# Altium schematic sheet CONN_INPUT.SchDoc
size 558 x 431 mm; SheetNumber: 2; SheetTotal: 6; SPICEModelCacheBADTCNOH: <root> / <DocumentId>BADTCNOH</DocumentId> / </root>
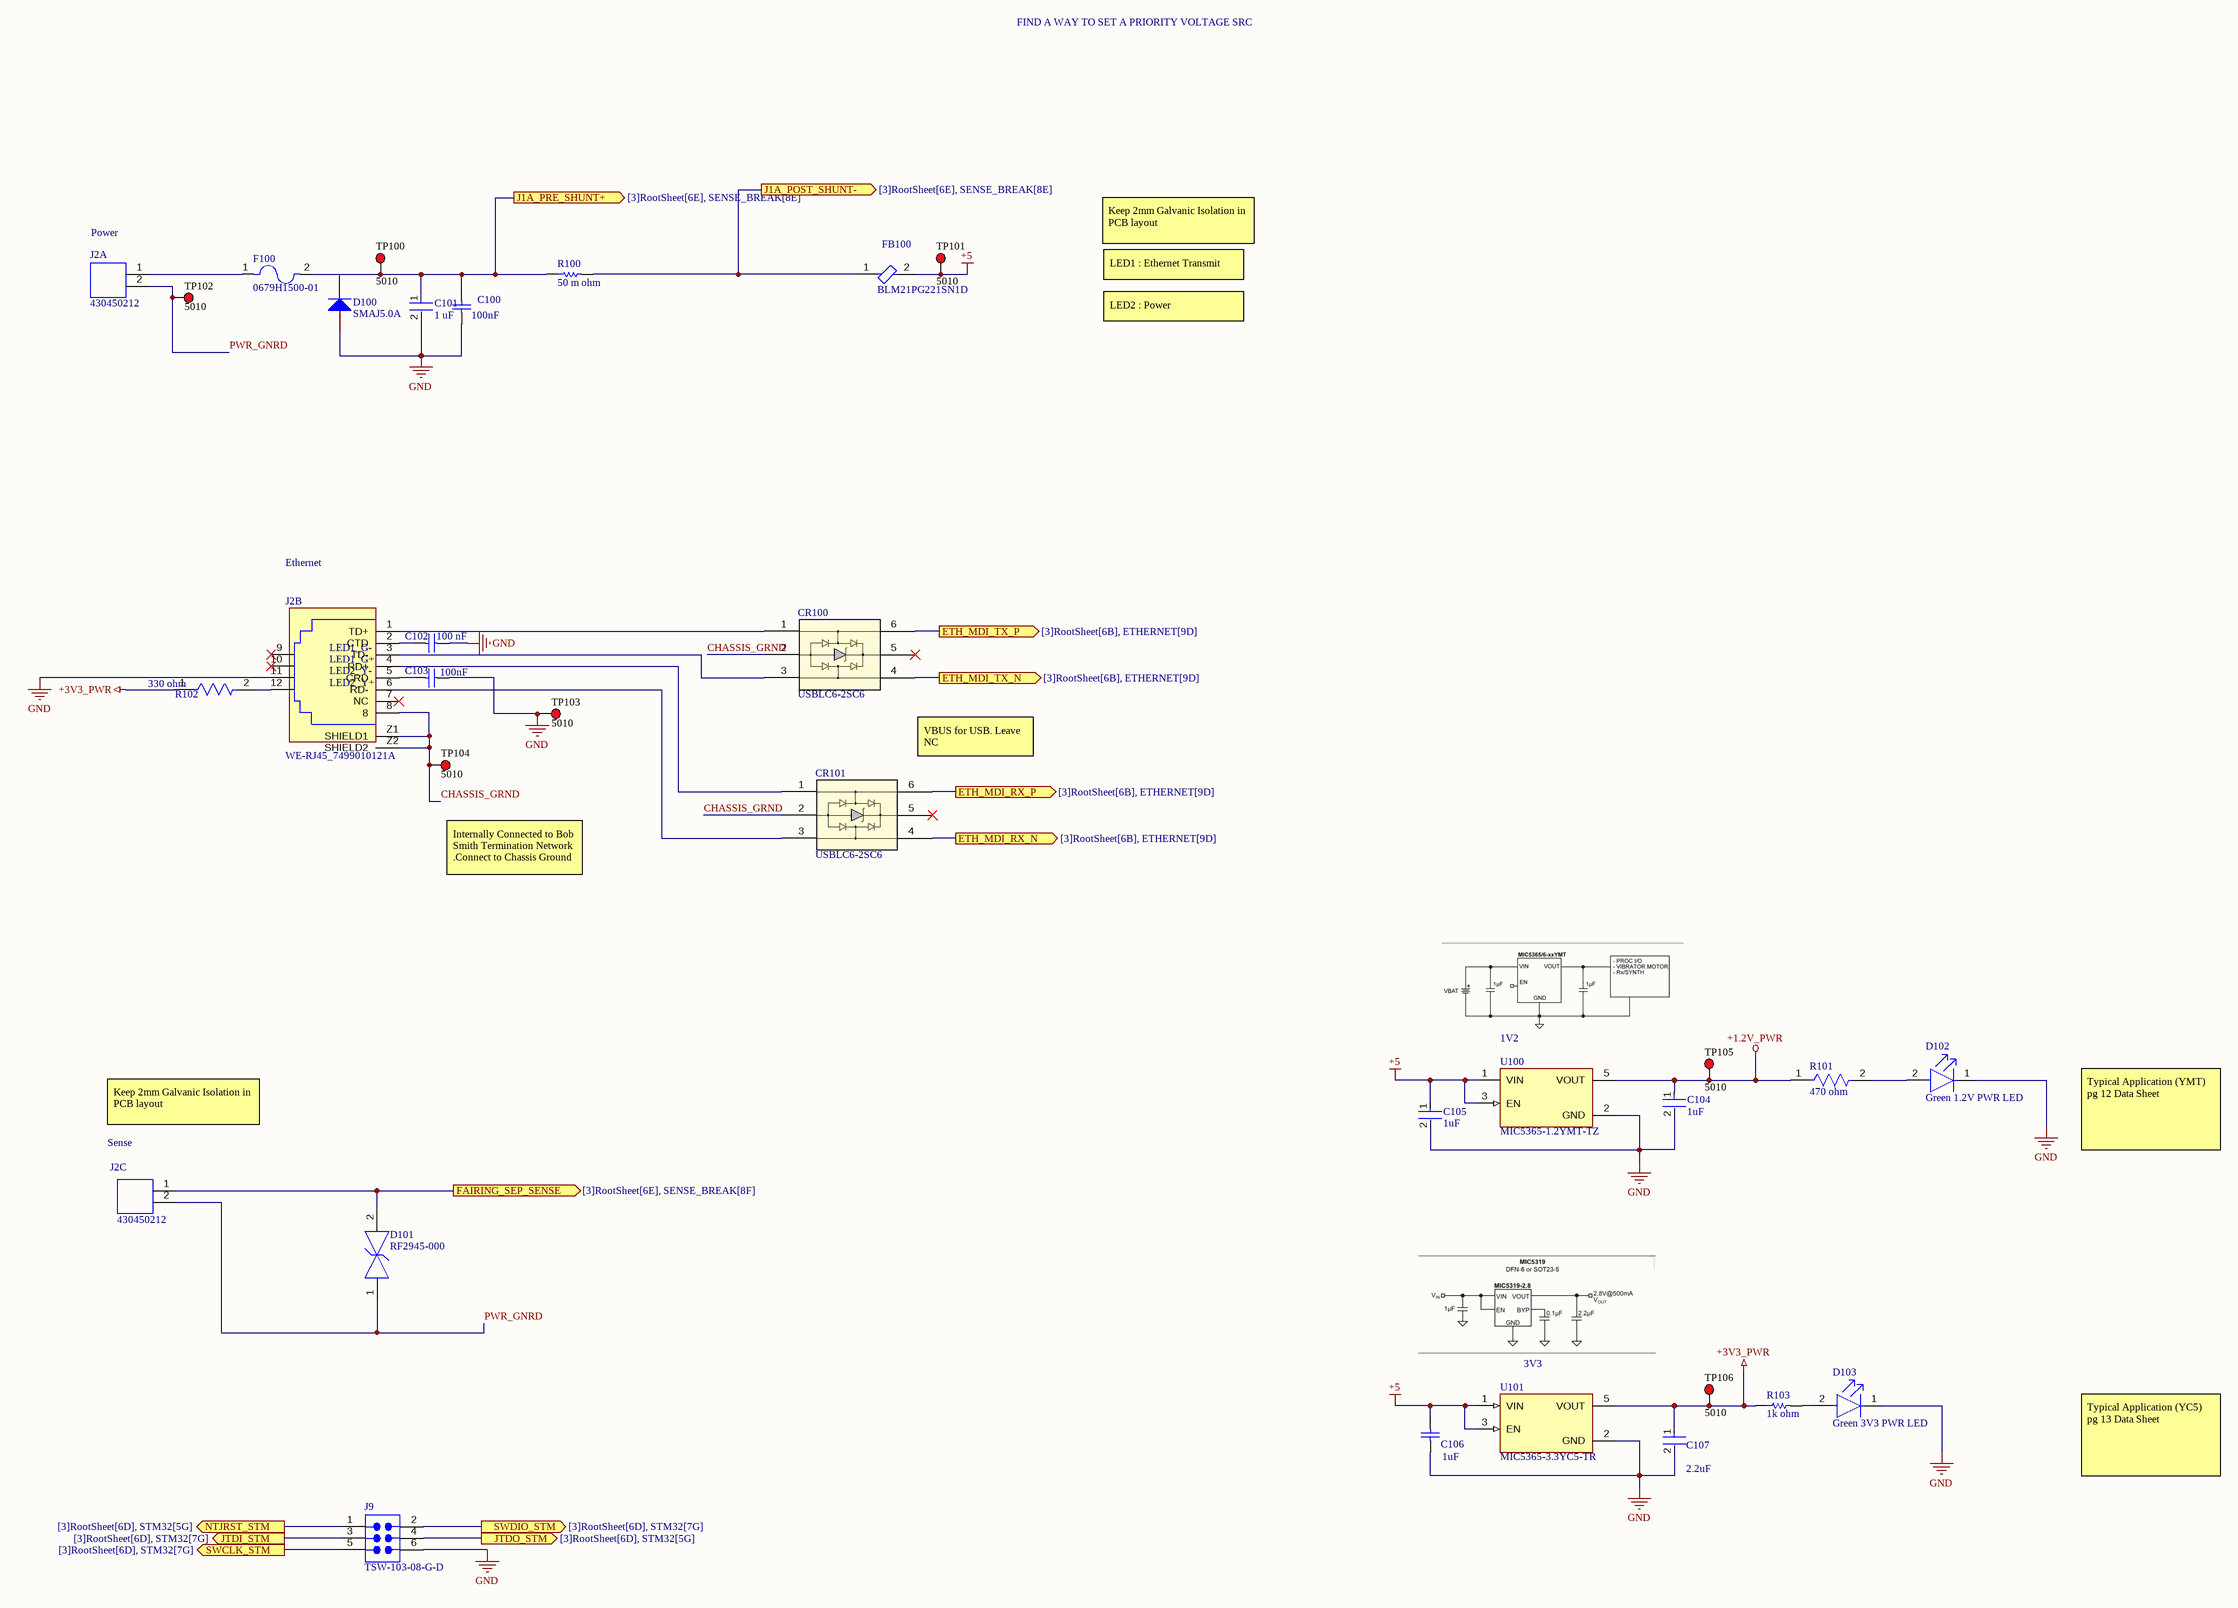
[diagram p0: CONN_INPUT.SchDoc]

## Parts
C100  100nF  [CAPC0603(1608)100_L]
C101  1 uF  [FP-GRM15-0_1-MFG]
C102  100 nF  [CAPC0603(1608)100_L]
C103  100nF  [CAPC0603(1608)100_L]
C104  1uF  [FP-GRM15-0_1-MFG]
C105  1uF  [FP-GRM15-0_1-MFG]
C106  1uF  [CAPC1005X55X10LL05]
C107  2.2uF  [FP-CC0603-DC-MFG]
CR100  USBLC6-2SC6  [SOT23-6L_STM]
CR101  USBLC6-2SC6  [SOT23-6L_STM]
D100  SMAJ5.0A  [BOUR-SMA-2_V]
D101  RF2945-000  [FP-SESD0402-MFG]
D102  Green 1.2V PWR LED  [FP-APHD1608LZGCK-MFG]
D103  Green 3V3 PWR LED  [FP-APHD1608LZGCK-MFG]
F100  0679H1500-01  [FUSC6125X279N]
FB100  BLM21PG221SN1D  [FP-BLM21-0_2-t0_85-e0_5-IPC_B]
J2A  430450212  [CONN_SD-43045-005_02_MOL]
J2B  WE-RJ45_7499010121A  [7499010121A]
J2C  430450212  [CONN_SD-43045-005_02_MOL]
J9  TSW-103-08-G-D  [SMTC-TSW-103-08-X-D]
R100  50 m ohm  [RESC3216X89X51LL25T25]
R101  470 ohm  [FP-RMCF0805-IPC_C]
R102  330 ohm  [FP-RMCF0603-MFG]
R103  1k ohm  [RESC2010(5025)_L]
TP100  5010  [KSTN-5010_V]
TP101  5010  [KSTN-5010_V]
TP102  5010  [KSTN-5010_V]
TP103  5010  [KSTN-5010_V]
TP104  5010  [KSTN-5010_V]
TP105  5010  [KSTN-5010_V]
TP106  5010  [KSTN-5010_V]
U100  MIC5365-1.2YMT-TZ  [TMLF-4_MCH]
U101  MIC5365-3.3YC5-TR  [TMLF-4_MCH]

## Ports
ETH_MDI_RX_N (out, see [3]RootSheet[6B], ETHERNET[9D]), ETH_MDI_RX_P (out, see [3]RootSheet[6B], ETHERNET[9D]), ETH_MDI_TX_N (out, see [3]RootSheet[6B], ETHERNET[9D]), ETH_MDI_TX_P (out, see [3]RootSheet[6B], ETHERNET[9D]), FAIRING_SEP_SENSE (out, see [3]RootSheet[6E], SENSE_BREAK[8F]), J1A_POST_SHUNT- (out, see [3]RootSheet[6E], SENSE_BREAK[8E]), J1A_PRE_SHUNT+ (out, see [3]RootSheet[6E], SENSE_BREAK[8E]), JTDI_STM (out, see [3]RootSheet[6D], STM32[7G]), JTDO_STM (out, see [3]RootSheet[6D], STM32[5G]), NTJRST_STM (out, see [3]RootSheet[6D], STM32[5G]), SWCLK_STM (out, see [3]RootSheet[6D], STM32[7G]), SWDIO_STM (out, see [3]RootSheet[6D], STM32[7G])

## Nets
+1.2V_PWR: C104.1 R101.1 TP105.1 U100.5(VOUT)
+3V3_PWR: C107.1 R102.1 R103.1 TP106.1 U101.5(VOUT)
+5: C105.1 C106.2 FB100.2 TP101.1 U100.1(VIN) U100.3(EN) U101.1(VIN) U101.3(EN)
GND: C100.1 C101.2 C102.1 C103.1 C104.2 C105.2 C106.1 C107.2 D100.1(A) D102.1(C) D103.1(C) J2B.11(LED2_Y-) J9.6 TP103.1 U100.2(GND) U101.2(GND)
CHASSIS_GRND: CR100.2 CR101.2 J2B.8 J2B.Z1(SHIELD1) J2B.Z2(SHIELD2) TP104.1
ETH_MDI_RX_N: CR101.4 ; port ETH_MDI_RX_N
ETH_MDI_RX_P: CR101.6 ; port ETH_MDI_RX_P
ETH_MDI_TX_N: CR100.4 ; port ETH_MDI_TX_N
ETH_MDI_TX_P: CR100.6 ; port ETH_MDI_TX_P
FAIRING_SEP_SENSE: D101.2 J2C.1 ; port FAIRING_SEP_SENSE
J1A_POST_SHUNT-: FB100.1 R100.2 ; port J1A_POST_SHUNT-
J1A_PRE_SHUNT+: C100.2 C101.1 F100.2 R100.1 TP100.1 ; port J1A_PRE_SHUNT+
JTDI_STM: J9.3 ; port JTDI_STM
JTDO_STM: J9.4 ; port JTDO_STM
NTJRST_STM: J9.1 ; port NTJRST_STM
PWR_GNRD: D101.1 J2A.2 J2C.2 TP102.1
SWCLK_STM: J9.5 ; port SWCLK_STM
SWDIO_STM: J9.2 ; port SWDIO_STM
NetC102_2: C102.2 J2B.2(CTD)
NetC103_2: C103.2 J2B.5(CRD)
NetCR100_1: CR100.1 J2B.1(TD+)
NetCR100_3: CR100.3 J2B.3(TD-)
NetCR101_1: CR101.1 J2B.4(RD+)
NetCR101_3: CR101.3 J2B.6(RD-)
NetD102_2: D102.2(A) R101.2
NetD103_2: D103.2(A) R103.2
NetF100_1: F100.1 J2A.1
NetJ2B_12: J2B.12(LED2_Y+) R102.2

Not connected (* = marked no-connect by the designer): CR100 5*; CR101 5*; D100 2(K); J2B 7(NC)* 9(LED1_G-)* 10(LED1_G+)*

## Notes on the sheet
- FIND A WAY TO SET A PRIORITY VOLTAGE SRC
- (near J2A) Power
- Keep 2mm Galvanic Isolation in PCB layout
- LED1 : Ethernet Transmit
- LED2 : Power
- Ethernet
- VBUS for USB. Leave NC
- Internally Connected to Bob Smith Termination Network .Connect to Chassis Ground
- (near U100) 1V2
- (near J2C) Sense
- Typical Application (YMT) pg 12 Data Sheet
- (near U101) 3V3
- Typical Application (YC5) pg 13 Data Sheet
- DWG. NO.
- REV.
- SHT.
- REVISION
- DESCRIPTION
- DATE
- APPROVED
- THIS DOCUMENT AND THE DATA DISCLOSED HEREIN OR HEREWITH IS THE PROPERTY OF ALTIUM LIMITED AND MAY BE FREELY DISTRIBUTED IN WHOLE. NO RIGHTS ARE RESERVED OR EXPRESS OR IMPLIED WARANTEE GIVEN.
- ENG:
- DSN:
- APPROVALS
- PROJECT
- DOCUMENT REVISION:
- DESIGN ITEM:
- CHK:
- BOM:
- REFERENCE DOCUMENTS
- PROJECT REVISION:
- TITLE
- FAB DWG:
- PCB DWG:
- ASSY DWG:
- SCALE:
- SIZE
- C
- CAGE CODE
- FILE NAME
- DWG NO.
- SHEET
- OF
- REV

## Library data of the parts
C100 C102 C103 = CMP-1035-02591-1: CAP 100nF 50V ±5% 0603 (1608 Metric) Thickness 1mm SMD; Tolerance: Â±5%; Case-Metric: 1608; Case-EIA: 0603; Rated Voltage: 50 V; Max Thickness: 1 mm; Technology: SMT; Value: 100nF
C101 C104 C105 = CMP-2008-04556-2: CAP CER 1UF 10V X5R 0402; Manufacturer Part Number: GRM155R61A105KE15D; Manufacturer: Murata; Material: Ceramic; Tolerance: 10%; Temperature Coefficient: 15%; Octopart: https://octopart.com/grm155r61a105ke15d-murata-197442; Lead Free: Yes; ComponentLink2Description: Datasheet; Temperature: -55°C to +85°C; Temperature Range High: +85°C; Height: 0.55mm; Capacitance: 1uF; Ipc Land Pattern Name: CAPC10050X50; ComponentLink2URL: https://search.murata.co.jp/Ceramy/image/img/A01X/G101/ENG/GRM155R61A105KE15-01A.pdf; Temperature Range Low: -55°C; Device Class L2: Capacitors; Voltage Rating: 10V; RoHS: TRUE; Device Class L1: Passive Components; Device Class L3: Ceramic Capacitors; Temperature Characteristic: X5R; Mouser Description: 0402 1 uF 10 V ±10% Tolerance X5R Surface Mount Multilayer Ceramic Capacitor; Automotive: No; Package: GRM15-0.1; Digikey Description: CAP CER 1UF 10V X5R 0402; Value: 1uF; Category: Cap
C106 = CMP-2000-05996-1: Multilayer Ceramic Chip Capacitor, 1 uF, +/- 10%, 10 V, -55 to 85 degC, 0402 (1005 Metric), RoHS, Tape and Reel; Manufacturer: TDK; PCN Part Number: MLCCPartNumberChange30/Nov/2012; Product Training Modules: CSeriesGeneralApplicationsSEAT,CCV,andTVCLDesignToolsGuidetoReplacinganElectrolyticCapacitorwithanMLCC; Voltage - Rated: 10V; Temperature Coefficient: X5R; Online Catalog: CSeries,GeneralPurpose; Capacitance: 1µF; Other Names: 445-4114-6; Category: Capacitors; Features: -; Lead Style: -; RoHS Information: RoHSCertificate-MLCC; Manufacturer URL: http://www.tdk.com/; Lead Spacing: -; Thickness (Max): 0.022"(0.55mm); Applications: GeneralPurpose; Tolerance: ±10%; Mounting Technology: SurfaceMount; Mounting Type: SurfaceMount,MLCC; Operating Temperature: -55°C~85°C; Datasheet URL: http://download.siliconexpert.com/pdfs/2015/4/21/15/54/45/779/tdk_/manual/37024850441143360mlcc_commercial_general_en.pdf; Package Reference: 1005; Height - Seated (Max): -; Family: CeramicCapacitors; Datasheet Version: 03/2015; Package Description: 2-Pin Surface Mount Device, Body 1 x 0.5 mm; Packaging: Digi-Reel®; Size / Dimension: 0.039"Lx0.020"W(1.00mmx0.50mm); Standard Package: 1; Package / Case: 0402(1005Metric); Ratings: -; Series: C
C107 = CMP-03422-000578-2: CAP CER 2.2UF 50V X5R 0603; Tolerance: 10%; Packaging: Cut Tape; Capacitance: 2.2uF; Min Operating Temperature: -55°C; RoHS Compliant: Yes; Max Operating Temperature: 85°C; Case Code (Metric): 1608; Voltage Rating: 50V; Case/Package: 0603; Case Code (Imperial): 0603; Mount: Surface Mount
CR100 CR101 = USBLC6-2SC6: ESD Protection for USB 2.0 High Speed; Manufacturer_Name: STMicroelectronics; Copyright: Copyright (C) 2025 Ultra Librarian. All rights reserved.; Manufacturer_Part_Number: USBLC6-2SC6; RefDes: RefDes; Type: Type
D100 = CMP-2000-07090-1: SMAJ Transient Voltage Suppressor Diode Series, 3.5 V, -55 to 150 degC, 2-Pin SMA, RoHS, Tape and Reel; Manufacturer: Bourns; EDA / CAD Models: DownloadfromAcceleratedDesigns; Unidirectional Channels: 1; Voltage - Breakdown (Min): 6.4V; Voltage - Reverse Standoff (Typ): 5V; Voltage - Clamping (Max) @ Ipp: 9.2V; Other Names: SMAJ5.0ABDKR; Type: Zener; Catalog Drawings: SMAJSeriesFootprintSMAJ,SMBJSeries; Featured Product: SMAJ/SMBJ/SMCJ/SMLJDiscreteTVSDiodes; Power - Peak Pulse: 400W; Current - Peak Pulse (10/1000µs): 43.5A; Power Line Protection: No; Online Catalog: SMAJSeries; Supplier Device Package: SMA(DO-214AC); Operating Temperature: -55°C~150°C(TJ); Package Description: 2-Pin Surface Mount Device, Body 4.315 x 2.605 mm; Datasheet URL: https://datasheet.ciiva.com/25624/0900766b8112213b-25624680.pdf; Manufacturer URL: http://www.bourns.com/; Datasheet Version: 08/2012; Series: SMAJ; Family: TVS-Diodes; Bidirectional Channels: -; Applications: GeneralPurpose; Package Reference: SMA-2; Standard Package: 1; Package / Case: DO-214AC,SMA; Category: CircuitProtection; RoHS Information: SMAJSeriesMaterialDeclaration; Mounting Technology: SurfaceMount; Capacitance @ Frequency: -; Packaging: Digi-Reel®; Mounting Type: SurfaceMount
D101 = CMP-08607-000062-1: TVS DIODE 7V 10V 0402; Manufacturer: Littelfuse; Value: 0.1pF; Breakdown Voltage: 9.8V; Number Of Channels: 1; Peak Pulse Current: 2A; Direction: Bidirectional; Automotive Grade: Grade 1; Standoff Height: 0mm; Octopart: https://octopart.com/rf2945-000-littelfuse-56516902; Device Class L3: unset; ComponentLink2Description: Datasheet; Lead Free: Yes; Temperature Range Low: -55°C; Clamping Voltage: 10V; Digikey Description: TVS DIODE 7V 10V 0402; Category: Diode; Temperature: -55°C to +125°C; Device Class L1: Circuit Protection; Capacitance: 0.1pF; RoHS: TRUE; Device Class L2: TVS Diodes; Package: SESD0402; Reverse Standoff Voltage: 7V; Automotive: Yes; Height: 0.43mm; Manufacturer Part Number: RF2945-000; Temperature Range High: +125°C; ComponentLink2URL: https://www.littelfuse.com/~/media/electronics/datasheets/tvs_diode_arrays/littelfuse_tvs_diode_array_sesd_ultra_low_capacitance_discrete_tvs_datasheet.pdf.pdf
D102 D103 = CMP-44529-000045-1: LED GREEN CLEAR 1608 SMD; Test Current: 2mA; Dominant Wavelength: 525nm; Lens Color: Colorless; Luminous Intensity: 180mcd; Viewing Angle: 100°; Forward Voltage: 2.65V; Lens Size: 0.7mm; Lens Style: Round; Mount: Surface Mount; Packaging: Tape and Reel; Lens Transparency: Clear; Height: 0.75mm; Case/Package: 0603; Length: 1.6mm; Case Code (Metric): 1608; Width: 0.8mm; Color: Green; Case Code (Imperial): 0603
F100 = 0679H1500-01: 2410 SMT Fuse | Quick Acting | 250mA | Higher AC Voltage; Package: None; Price: None; Value: *; MP: 0679H1500-01; Availability: Unavailable
FB100 = CMP-0686-00610-3: Chip Ferrite Bead, 0805, 220Ω @ 100MHz, 0.045Ω, 25%, 2A; Number of Circuits: 1; Shielding: Unshielded; DC Resistance (DCR): 45mR; Impedance: 220R; Radiation Hardening: No; Material: Ferrite; Frequency: 100MHz; Width: 1.25mm; DC Current: 2A; Max DC Current: 2A; Number of Lines: 1; Package Quantity: 1; Case Code (Metric): 2012; Current Rating: 2A; Case/Package: 0805; Current: 2A; Military Standard: Not; Core Material: Ferrite; Depth: 1.25mm; Contact Plating: Tin; DC Resistance-Max: 45mR; Max Operating Temperature: 125°C; Length: 2mm; Max Current Rating: 2A; REACH SVHC: No SVHC; Termination: SMD/SMT; Min Operating Temperature: -55°C; Series: BLM21P; Test Frequency: 100MHz; Tolerance: 25%; Number of Pins: 2; RoHS Compliant: Yes; Height: 0.85mm; Packaging: Tape and Reel; Lead Free: Lead Free; Case Code (Imperial): 0805
J2A J2C = 430450212: Connector Header Through Hole 2 position; MF: Molex; SnapEDA_Link: https://www.snapeda.com/parts/430450212/Molex/view-part/?ref=snap; Package: None; Value: *; MP: 430450212; Check_prices: https://www.snapeda.com/parts/430450212/Molex/view-part/?ref=eda
J2B = WE-RJ45_7499010121A: MF: {'manufacturer': u'Wurth Electronics'}; Package: None; Price: None; Value: *; MP: 7499010121A; Availability: Unavailable
J9 = CMP-1024-00338-1: 0.025" SQ Post Header, Through-hole, Vertical, -55 to 125 degC, 2.54 mm Pitch, 6-Pin, Male, RoHS; Manufacturer: Samtec; Pitch: 2.54 mm; ComponentLink1URL: http://www.samtec.com; ComponentLink2URL: http://www.samtec.com/documents/webfiles/pdf/TSW_TH.PDF; Temperature Range: -55 to 125 degC; RoHS: True; ComponentLink2Description: Datasheet; PackageReference: TSW-103-08-X-D; ComponentLink3Description: Package Specification; PackageDescription: .025[0.64] SQ. Post Terminal Strip Assembly; DatasheetVersion: F-214; Mounting Technology: Through-hole; ComponentLink1Description: Manufacturer URL; Orientation: Vertical; PartNumber: TSW-103-08-G-D; PackageVersion: DM, 8/1988; ComponentLink3URL: http://www.samtec.com/documents/webfiles/cpdf/TSW-XXX-XX-XXX-X-XX-XXX-MKT.pdf
R100 = CMP-2003-04361-1: Manufacturer: Vishay Dale; Part Number: WSL1206R0500FEA
R101 = CMP-26527-003746-1: 470Ω ±1% 0.125W 0805 Thick Film Chip Resistor AEC-Q200 compliant; Resistance: 470R; Temperature Coefficient: 100ppm/°C; Max Power Dissipation: 125mW; Resistor Type: Thick Film; Number of Terminations: 2; Packaging: Tape and Reel; RoHS Compliant: Yes; Case/Package: 0805; Mount: Surface Mount; Contact Plating: Tin; Series: RMCF; Min Operating Temperature: -55°C; Radiation Hardening: No; Features: Automotive AEC-Q200; Tolerance: 1%; Max Operating Temperature: 155°C
R102 = CMP-26527-002055-1: 220Ω ±5% 0.1W 0603 Thick Film Chip Resistor AEC-Q200 compliant; Resistance: 220R; Temperature Coefficient: 100ppm/°C; Min Operating Temperature: -55°C; Contact Plating: Tin; Max Operating Temperature: 155°C; Radiation Hardening: No; Tolerance: 5%; RoHS Compliant: Yes; Packaging: Tape and Reel; Mount: Surface Mount; Case/Package: 0603; Resistor Type: Thick Film
R103 = CMP-1017-00074-1: 1K 0.75W 5% 2010 (5025 Metric)  SMD; Case-EIA: 2010; Value: 1000.00 Ohm; Case-Metric: 5025; Technology: SMT; Tolerance: 5 %; Power: 0.75 W
TP100-TP106 = CMP-1672-00002-4: Test Point, Red, Through Hole, RoHS, Bulk; Manufacturer: Keystone; Contact Material: Bronze; Mounting Technology: Through Hole; RoHSCompliant: true; Pins: 1; Package Quantity: 100; ComponentLink2Description: Datasheet; Height: 8.12 mm; ComponentLink1URL: http://www.keyelco.com/; DatasheetVersion: Rev. F, 12/2013; Mount: Through Hole; PackageReference: 5010; Contact Plating: Silver; Packaging: Bulk; Colour: Red; REACH SVHC: No SVHC; PackageDescription: 1-Pin Through Hole Device, Dia 3.17 mm; ComponentLink2URL: http://www.keyelco.com/product-pdf.cfm?p=1319; ComponentLink1Description: Manufacturer URL
U100 = MIC5365-1.2YMT-TZ: No Description Available; Manufacturer_Name: Microchip; Copyright: Copyright (C) 2026 Ultra Librarian. All rights reserved.; Manufacturer_Part_Number: MIC5365-1.2YMT-TZ; RefDes: RefDes; Type: Type
U101 = MIC5365-3.3YC5-TR: Linear Voltage Regulator IC Positive Fixed 1 Output 150mA SC-70-5; MF: Microchip; SnapEDA_Link: https://www.snapeda.com/parts/MIC5365-3.3YC5-TR/Microchip/view-part/?ref=snap; Package: SC-70-5 Microchip; Value: *; MP: MIC5365-3.3YC5-TR; Check_prices: https://www.snapeda.com/parts/MIC5365-3.3YC5-TR/Microchip/view-part/?ref=eda